# Altium project ELF 2 & ELF 2_Lite V1.3.PrjPcb (part 3 of 3)
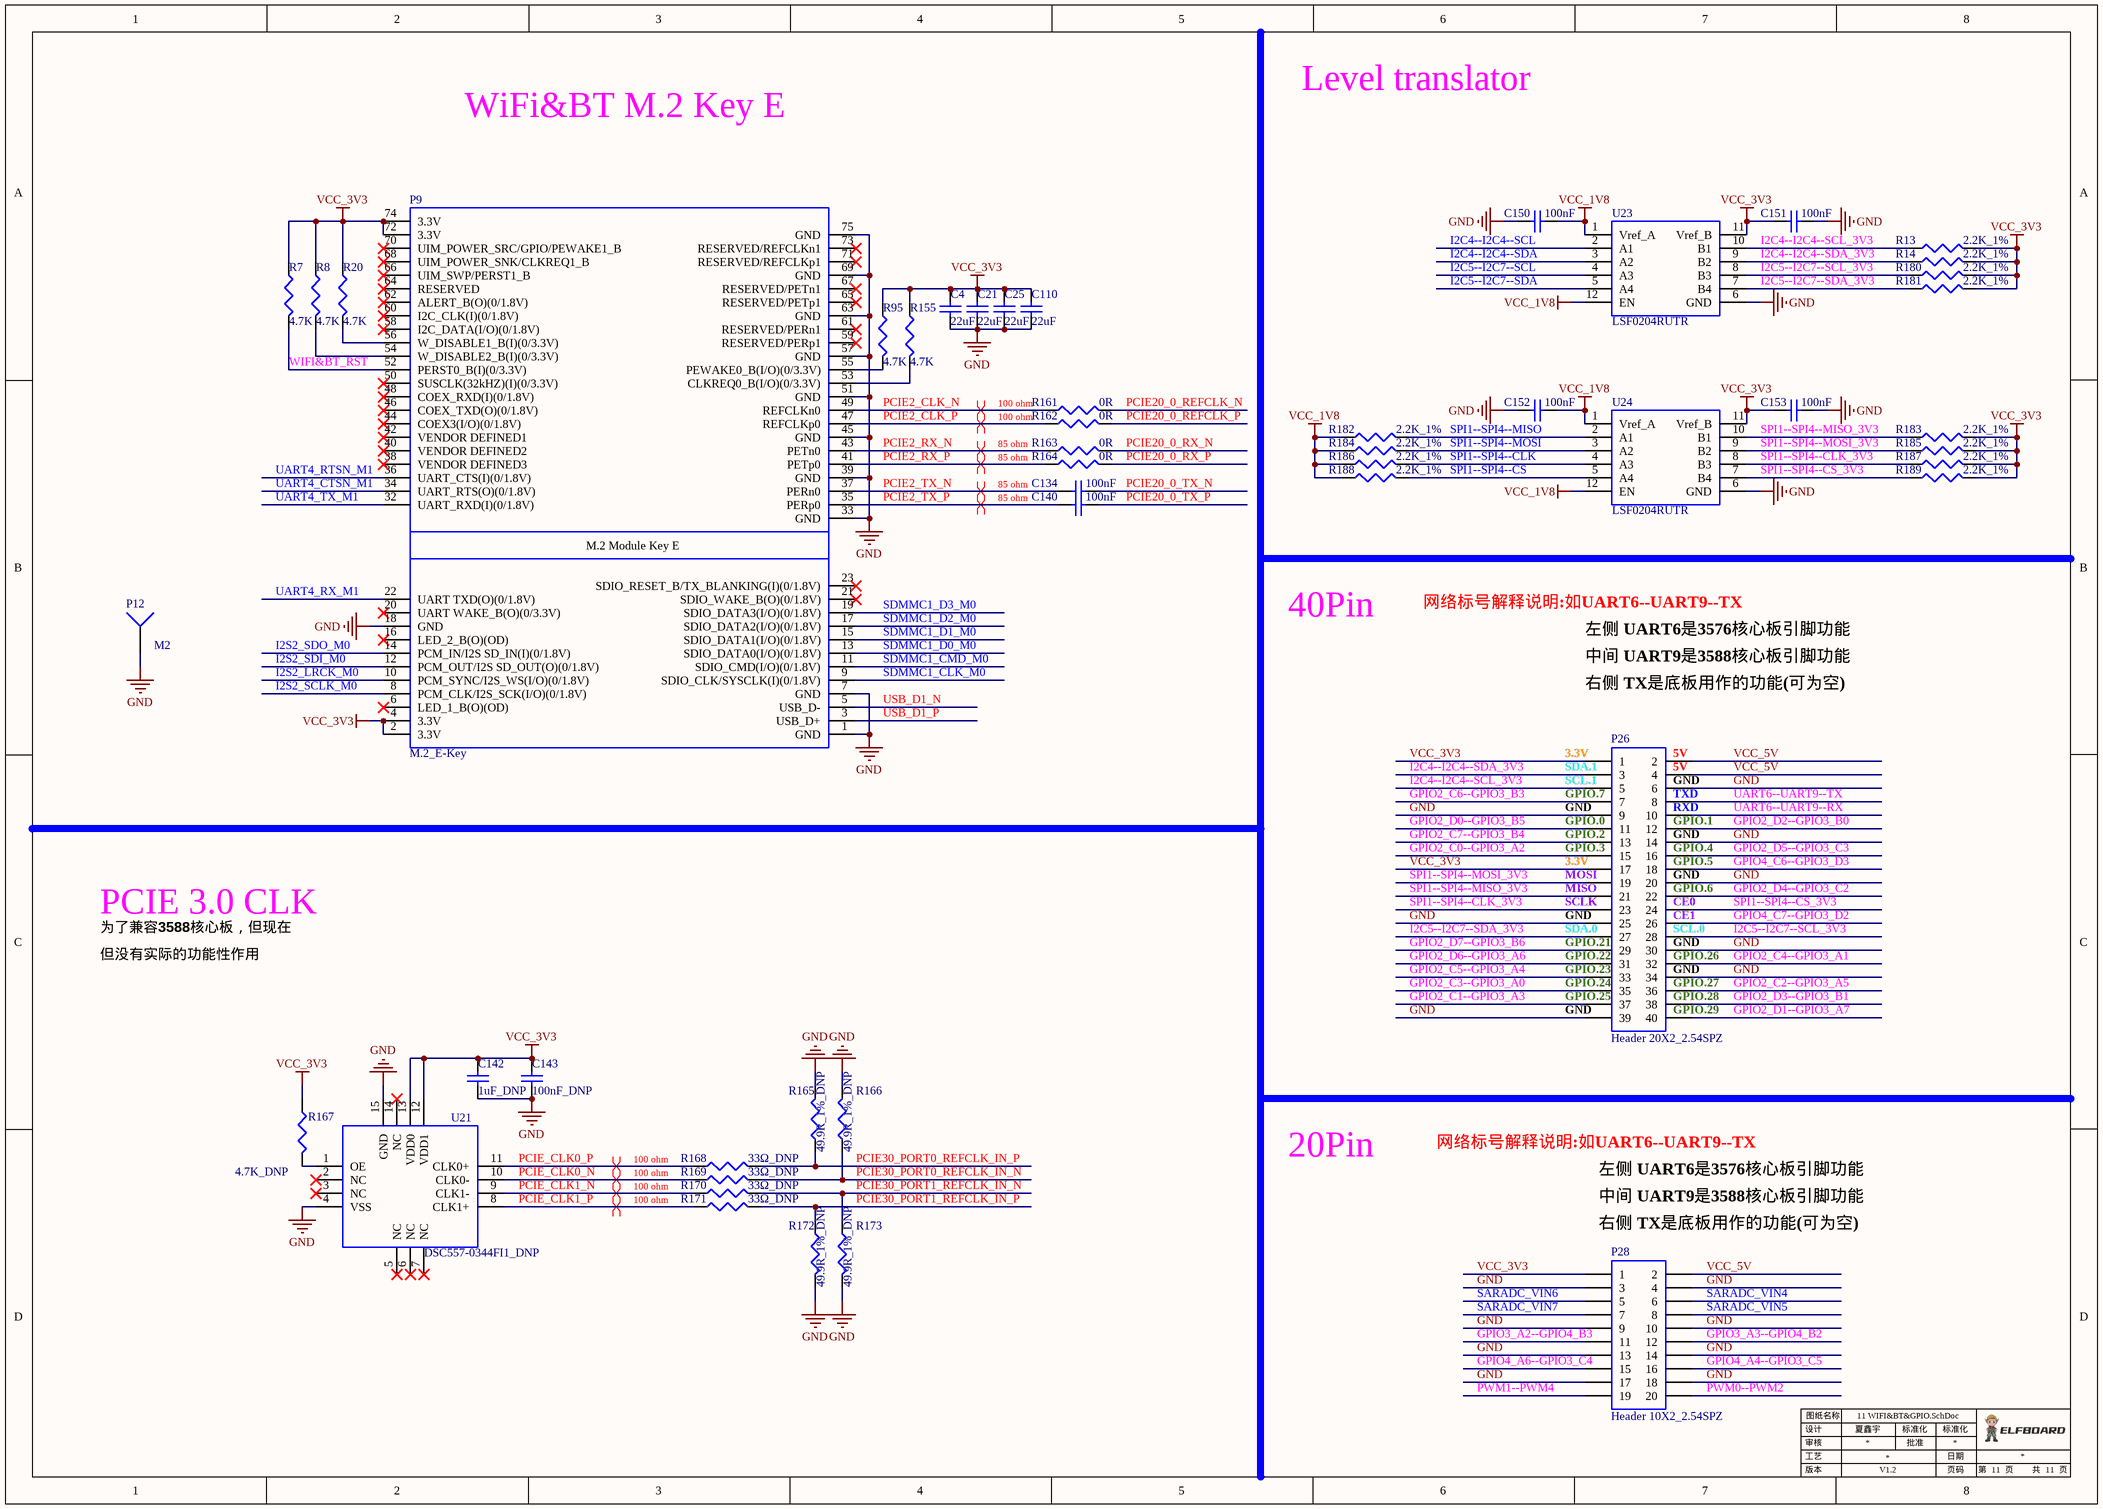
[diagram p14: 11 WIFI&BT&GPIO.SchDoc]

## Nets that join several sheets
GND: 02 Connector (103 pins), 03 PWR (54 pins), 04 Debug&TF card&RTC (29 pins), 05 Ethernet (30 pins), 06 MIPI (42 pins), 07 HDMI (26 pins), 08 TypeC USB DP (33 pins), 09 Audio (37 pins), 10 USB2.0 HUB&PCIe (52 pins), 11 WIFI&BT&GPIO (46 pins)
VCC12V_DCIN: 02 Connector (10 pins), 03 PWR (9 pins)
VCC_1V8: 02 Connector (6 pins), 03 PWR (C6.2 U1.5), 04 Debug&TF card&RTC (R45.1), 05 Ethernet (Q7.1 R70.1 R74.2 R75.1), 07 HDMI (R96.1 R97.1), 08 TypeC USB DP (R113.2), 11 WIFI&BT&GPIO (10 pins)
VCC_3V3: 02 Connector (R1.1 R2.1 R5.1 R6.1), 03 PWR (9 pins), 04 Debug&TF card&RTC (9 pins), 05 Ethernet (10 pins), 06 MIPI (10 pins), 07 HDMI (5 pins), 08 TypeC USB DP (8 pins), 09 Audio (C115.2 R125.1 U18.1), 10 USB2.0 HUB&PCIe (19 pins), 11 WIFI&BT&GPIO (33 pins)
VCC_5V: 03 PWR (13 pins), 06 MIPI (6 pins), 07 HDMI (5 pins), 08 TypeC USB DP (7 pins), 09 Audio (5 pins), 10 USB2.0 HUB&PCIe (7 pins), 11 WIFI&BT&GPIO (P26.2 P26.4 P28.2)
CARRIER_EN: 02 Connector (P3.87), 03 PWR (Q1.2)
DP_TX_AUX_N: 02 Connector (P3.24), 08 TypeC USB DP (C83.1)
DP_TX_AUX_P: 02 Connector (P3.22), 08 TypeC USB DP (C82.1)
GMAC0_INT: 02 Connector (P3.94), 05 Ethernet (D4.1 R74.1)
GMAC0_MDC_M0: 02 Connector (P4.49), 05 Ethernet (U7.14)
GMAC0_MDIO_M0: 02 Connector (P4.47), 05 Ethernet (R70.2 U7.15)
GMAC0_RESET: 02 Connector (P3.92), 05 Ethernet (Q7.2 R75.2)
GMAC0_RXCLK_M0: 02 Connector (P4.34), 05 Ethernet (R54.1 R64.1)
GMAC0_RXCTL_M0: 02 Connector (P4.32), 05 Ethernet (R56.1 R63.1)
GMAC0_RXD0_M0: 02 Connector (P4.30), 05 Ethernet (R61.1 R62.1)
GMAC0_RXD1_M0: 02 Connector (P4.28), 05 Ethernet (R60.1 R65.1)
GMAC0_RXD2_M0: 02 Connector (P4.26), 05 Ethernet (R59.1 R66.1)
GMAC0_RXD3_M0: 02 Connector (P4.24), 05 Ethernet (R58.1 R67.1)
GMAC0_TXCLK_M0: 02 Connector (P4.20), 05 Ethernet (R57.1)
GMAC0_TXCTL_M0: 02 Connector (P4.18), 05 Ethernet (R55.1)
GMAC0_TXD0_M0: 02 Connector (P4.16), 05 Ethernet (R53.1)
GMAC0_TXD1_M0: 02 Connector (P4.14), 05 Ethernet (R51.1)
GMAC0_TXD2_M0: 02 Connector (P4.12), 05 Ethernet (R50.1)
GMAC0_TXD3_M0: 02 Connector (P4.10), 05 Ethernet (R49.1)
GPIO0_A5--GPIO1_B0--TYPEC0_INT: 02 Connector (P2.75), 08 TypeC USB DP (D8.1 R113.1)
GPIO0_B6--GPIO3_C7--TF_PWR: 02 Connector (P4.33), 04 Debug&TF card&RTC (R37.1)
GPIO0_C5--GPIO3_C0--MIPI_DSI_INT: 02 Connector (P4.1), 06 MIPI (P15.30)
GPIO0_C6--GPIO3_B2--MIPI_DSI_EN: 02 Connector (P4.39), 06 MIPI (P15.9)
GPIO0_D0--GPIO3_B7--MIPI_DSI_RESET: 02 Connector (P4.9), 06 MIPI (P15.29)
GPIO0_D1--GPIO0_D0--PWREN: 02 Connector (P4.4), 08 TypeC USB DP (R103.1)
GPIO0_D3--GPIO1_B2--HP_DET_L: 02 Connector (P2.29), 09 Audio (R127.1 R130.1)
GPIO2_A6--GPIO4_A0--PUPDCTL1: 02 Connector (P1.82), 08 TypeC USB DP (R100.1)
GPIO2_A7--GPIO4_B0--PUPDCTL2: 02 Connector (P1.48), 08 TypeC USB DP (R106.1)
GPIO2_B0--GPIO4_B1--HDMI_ON: 02 Connector (P1.46), 07 HDMI (Q10.1 Q11.1 Q12.1 Q13.1)
GPIO2_B1--GPIO4_A1--USB_RST: 02 Connector (P1.80), 10 USB2.0 HUB&PCIe (R157.2)
GPIO2_B3--GPIO4_A2--EN: 02 Connector (P1.76), 06 MIPI (P16.5)
GPIO2_B5--GPIO4_B6--GPIO: 02 Connector (P1.50), 06 MIPI (P16.4)
GPIO2_C0--GPIO3_A2: 02 Connector (P4.54), 11 WIFI&BT&GPIO (P26.15)
GPIO2_C1--GPIO3_A3: 02 Connector (P4.52), 11 WIFI&BT&GPIO (P26.37)
GPIO2_C2--GPIO3_A5: 02 Connector (P4.62), 11 WIFI&BT&GPIO (P26.36)
GPIO2_C3--GPIO3_A0: 02 Connector (P4.40), 11 WIFI&BT&GPIO (P26.35)
GPIO2_C4--GPIO3_A1: 02 Connector (P4.38), 11 WIFI&BT&GPIO (P26.32)
GPIO2_C5--GPIO3_A4: 02 Connector (P4.48), 11 WIFI&BT&GPIO (P26.33)
GPIO2_C6--GPIO3_B3: 02 Connector (P4.44), 11 WIFI&BT&GPIO (P26.7)
GPIO2_C7--GPIO3_B4: 02 Connector (P4.42), 11 WIFI&BT&GPIO (P26.13)
GPIO2_D0--GPIO3_B5: 02 Connector (P4.46), 11 WIFI&BT&GPIO (P26.11)
GPIO2_D1--GPIO3_A7: 02 Connector (P4.58), 11 WIFI&BT&GPIO (P26.40)
GPIO2_D2--GPIO3_B0: 02 Connector (P4.56), 11 WIFI&BT&GPIO (P26.12)
GPIO2_D3--GPIO3_B1: 02 Connector (P4.60), 11 WIFI&BT&GPIO (P26.38)
GPIO2_D4--GPIO3_C2: 02 Connector (P4.7), 11 WIFI&BT&GPIO (P26.22)
GPIO2_D5--GPIO3_C3: 02 Connector (P4.5), 11 WIFI&BT&GPIO (P26.16)
GPIO2_D6--GPIO3_A6: 02 Connector (P4.35), 11 WIFI&BT&GPIO (P26.31)
GPIO2_D7--GPIO3_B6: 02 Connector (P4.37), 11 WIFI&BT&GPIO (P26.29)
GPIO3_A2--GPIO4_B3: 02 Connector (P1.66), 11 WIFI&BT&GPIO (P28.11)
GPIO3_A3--GPIO4_B2: 02 Connector (P1.54), 11 WIFI&BT&GPIO (P28.12)
GPIO3_D6--GPIO1_C6--CAM1_nRST: 02 Connector (P2.51), 06 MIPI (P14.19)
GPIO4_A4--GPIO3_C5: 02 Connector (P4.29), 11 WIFI&BT&GPIO (P28.16)
GPIO4_A6--GPIO3_C4: 02 Connector (P4.31), 11 WIFI&BT&GPIO (P28.15)
GPIO4_B1--GPIO1_D3--CAM1_PWRDN: 02 Connector (P2.61), 06 MIPI (P14.20)
GPIO4_C0--GPIO4_C1--HDMI_CEC: 02 Connector (P1.52), 07 HDMI (Q14.2 R94.2)
GPIO4_C1--GPIO1_A5--HPDIN: 02 Connector (P2.71), 07 HDMI (Q15.3 R96.2)
GPIO4_C2--GPIO4_B7--HDMI_SCL: 02 Connector (P1.68), 07 HDMI (Q8.2 R81.2)
GPIO4_C3--GPIO4_C0--HDMI_SDA: 02 Connector (P1.58), 07 HDMI (C71.1 Q9.2 R83.2)
GPIO4_C6--GPIO3_D3: 02 Connector (P4.17), 11 WIFI&BT&GPIO (P26.18)
GPIO4_C7--GPIO3_D2: 02 Connector (P4.19), 11 WIFI&BT&GPIO (P26.26)
HDMI_TX_D0_N: 02 Connector (P1.29), 07 HDMI (C65.1)
HDMI_TX_D0_P: 02 Connector (P1.31), 07 HDMI (C66.1)
HDMI_TX_D1_N: 02 Connector (P1.35), 07 HDMI (C67.1)
HDMI_TX_D1_P: 02 Connector (P1.37), 07 HDMI (C68.1)
HDMI_TX_D2_N: 02 Connector (P1.41), 07 HDMI (C69.1)
HDMI_TX_D2_P: 02 Connector (P1.43), 07 HDMI (C70.1)
HDMI_TX_D3_N: 02 Connector (P1.23), 07 HDMI (C63.1)
HDMI_TX_D3_P: 02 Connector (P1.25), 07 HDMI (C64.1)
HDMI_TX_SBD_N: 02 Connector (P1.17), 07 HDMI (C73.1)
HDMI_TX_SBD_P: 02 Connector (P1.19), 07 HDMI (C72.1)
I2C2--I2C2--SCL: 02 Connector (P2.11 R1.2), 06 MIPI (P15.26), 08 TypeC USB DP (U16.6)
I2C2--I2C2--SDA: 02 Connector (P2.1 R2.2), 06 MIPI (P15.27), 08 TypeC USB DP (U16.7)
I2C3--I2C3--SCL: 02 Connector (P2.35 R3.2), 06 MIPI (P14.18), 09 Audio (C103.2 U17.16)
I2C3--I2C3--SDA: 02 Connector (P2.43 R4.2), 06 MIPI (P14.17), 09 Audio (C102.2 U17.17)
I2C4--I2C4--SCL: 02 Connector (P4.45 R10.2), 11 WIFI&BT&GPIO (U23.2)
I2C4--I2C4--SDA: 02 Connector (P4.43 R9.2), 11 WIFI&BT&GPIO (U23.3)
I2C5--I2C7--SCL: 02 Connector (P2.31 R11.2), 11 WIFI&BT&GPIO (U23.4)
I2C5--I2C7--SDA: 02 Connector (P2.33 R12.2), 11 WIFI&BT&GPIO (U23.5)
I2C7--I2C5--SCL: 02 Connector (P1.70 R5.2), 04 Debug&TF card&RTC (U6.6), 06 MIPI (P16.3)
I2C7--I2C5--SDA: 02 Connector (P1.72 R6.2), 04 Debug&TF card&RTC (U6.5), 06 MIPI (P16.2)
I2S1--I2S0--LRCK: 02 Connector (P2.53), 09 Audio (R118.1)
I2S1--I2S0--MCLK: 02 Connector (P2.65), 09 Audio (R116.1)
I2S1--I2S0--SCLK: 02 Connector (P2.55), 09 Audio (R117.1)
I2S1--I2S0--SDI0: 02 Connector (P2.59), 09 Audio (R120.1)
I2S1--I2S0--SDO0: 02 Connector (P2.49), 09 Audio (R119.1)
I2S2_LRCK_M0: 02 Connector (P3.51), 11 WIFI&BT&GPIO (P9.10)
I2S2_SCLK_M0: 02 Connector (P3.47), 11 WIFI&BT&GPIO (P9.8)
I2S2_SDI_M0: 02 Connector (P3.53), 11 WIFI&BT&GPIO (P9.12)
I2S2_SDO_M0: 02 Connector (P3.45), 11 WIFI&BT&GPIO (P9.14)
MIPI_DPHY_CSI0_RX_CLK_N: 02 Connector (P3.72), 06 MIPI (P14.3)
MIPI_DPHY_CSI0_RX_CLK_P: 02 Connector (P3.70), 06 MIPI (P14.2)
MIPI_DPHY_CSI0_RX_D0_N: 02 Connector (P3.60), 06 MIPI (P14.6)
MIPI_DPHY_CSI0_RX_D0_P: 02 Connector (P3.58), 06 MIPI (P14.5)
MIPI_DPHY_CSI0_RX_D1_N: 02 Connector (P3.66), 06 MIPI (P14.9)
MIPI_DPHY_CSI0_RX_D1_P: 02 Connector (P3.64), 06 MIPI (P14.8)
MIPI_DPHY_CSI0_RX_D2_N: 02 Connector (P3.78), 06 MIPI (P14.12)
MIPI_DPHY_CSI0_RX_D2_P: 02 Connector (P3.76), 06 MIPI (P14.11)
MIPI_DPHY_CSI0_RX_D3_N: 02 Connector (P3.84), 06 MIPI (P14.15)
MIPI_DPHY_CSI0_RX_D3_P: 02 Connector (P3.82), 06 MIPI (P14.14)
MIPI_DPHY_CSI2_RX_CLK_N: 02 Connector (P4.95), 06 MIPI (P16.8)
MIPI_DPHY_CSI2_RX_CLK_P: 02 Connector (P4.97), 06 MIPI (P16.7)
MIPI_DPHY_CSI2_RX_D0_N: 02 Connector (P4.83), 06 MIPI (P16.14)
MIPI_DPHY_CSI2_RX_D0_P: 02 Connector (P4.85), 06 MIPI (P16.13)
MIPI_DPHY_CSI2_RX_D1_N: 02 Connector (P4.89), 06 MIPI (P16.11)
MIPI_DPHY_CSI2_RX_D1_P: 02 Connector (P4.91), 06 MIPI (P16.10)
MIPI_DPHY_DSI_TX_CLK_N: 02 Connector (P3.69), 06 MIPI (P15.18)
MIPI_DPHY_DSI_TX_CLK_P: 02 Connector (P3.71), 06 MIPI (P15.17)
MIPI_DPHY_DSI_TX_D0_N: 02 Connector (P3.57), 06 MIPI (P15.24)
MIPI_DPHY_DSI_TX_D0_P: 02 Connector (P3.59), 06 MIPI (P15.23)
MIPI_DPHY_DSI_TX_D1_N: 02 Connector (P3.63), 06 MIPI (P15.21)
MIPI_DPHY_DSI_TX_D1_P: 02 Connector (P3.65), 06 MIPI (P15.20)
MIPI_DPHY_DSI_TX_D2_N: 02 Connector (P3.75), 06 MIPI (P15.15)
MIPI_DPHY_DSI_TX_D2_P: 02 Connector (P3.77), 06 MIPI (P15.14)
MIPI_DPHY_DSI_TX_D3_N: 02 Connector (P3.81), 06 MIPI (P15.12)
MIPI_DPHY_DSI_TX_D3_P: 02 Connector (P3.83), 06 MIPI (P15.11)
PCIE0_REFCLK_N: 02 Connector (P2.64), 10 USB2.0 HUB&PCIe (R154.2)
PCIE0_REFCLK_P: 02 Connector (P2.66), 10 USB2.0 HUB&PCIe (R153.2)
PCIE0_RX_N: 02 Connector (P2.70), 10 USB2.0 HUB&PCIe (R160.2)
PCIE0_RX_P: 02 Connector (P2.72), 10 USB2.0 HUB&PCIe (R159.2)
PCIE0_TX_N: 02 Connector (P2.76), 10 USB2.0 HUB&PCIe (R158.2)
PCIE0_TX_P: 02 Connector (P2.78), 10 USB2.0 HUB&PCIe (R156.2)
PCIE20_0_REFCLK_N: 02 Connector (P2.82), 11 WIFI&BT&GPIO (R161.2)
PCIE20_0_REFCLK_P: 02 Connector (P2.84), 11 WIFI&BT&GPIO (R162.2)
PCIE20_0_RX_N: 02 Connector (P2.94), 11 WIFI&BT&GPIO (R163.2)
PCIE20_0_RX_P: 02 Connector (P2.96), 11 WIFI&BT&GPIO (R164.2)
PCIE20_0_TX_N: 02 Connector (P2.88), 11 WIFI&BT&GPIO (C134.2)
PCIE20_0_TX_P: 02 Connector (P2.90), 11 WIFI&BT&GPIO (C140.2)
PCIE30_PORT0_REFCLK_IN_N: 02 Connector (P2.46), 11 WIFI&BT&GPIO (R166.1 R169.2)
PCIE30_PORT0_REFCLK_IN_P: 02 Connector (P2.48), 11 WIFI&BT&GPIO (R165.1 R168.2)
PCIE30_PORT1_REFCLK_IN_N: 02 Connector (P2.6), 11 WIFI&BT&GPIO (R170.2 R173.1)
PCIE30_PORT1_REFCLK_IN_P: 02 Connector (P2.4), 11 WIFI&BT&GPIO (R171.2 R172.1)
PWM0--PWM2: 02 Connector (P2.3), 11 WIFI&BT&GPIO (P28.20)
PWM0--PWM5: 02 Connector (P2.13), 06 MIPI (P15.8)
PWM1--PWM4: 02 Connector (P2.5), 11 WIFI&BT&GPIO (P28.19)
RESET_L: 02 Connector (P2.100), 03 PWR (5 pins)
SARADC_VIN0_BOOT: 02 Connector (P1.28), 03 PWR (C12.2 DT4.1 K1.1 K1.2)
SARADC_VIN1_RECOVERY: 02 Connector (P1.30), 03 PWR (C20.2 DT6.1 K3.1 K3.2)
SARADC_VIN3_HP_HOOK: 02 Connector (P1.34), 09 Audio (R124.1 R126.2)
SARADC_VIN4: 02 Connector (P1.36), 11 WIFI&BT&GPIO (P28.6)
SARADC_VIN5: 02 Connector (P1.38), 11 WIFI&BT&GPIO (P28.8)
SARADC_VIN6: 02 Connector (P1.40), 11 WIFI&BT&GPIO (P28.5)
SARADC_VIN7: 02 Connector (P1.42), 11 WIFI&BT&GPIO (P28.7)
SDMMC0_CLK: 02 Connector (P1.7), 04 Debug&TF card&RTC (R42.1)
SDMMC0_CMD: 02 Connector (P1.9), 04 Debug&TF card&RTC (R41.1)
SDMMC0_D0: 02 Connector (P1.5), 04 Debug&TF card&RTC (R43.1)
SDMMC0_D1: 02 Connector (P1.3), 04 Debug&TF card&RTC (R44.1)
SDMMC0_D2: 02 Connector (P1.13), 04 Debug&TF card&RTC (R39.1)
SDMMC0_D3: 02 Connector (P1.11), 04 Debug&TF card&RTC (R40.1)
SDMMC0_DET_L: 02 Connector (P3.90), 04 Debug&TF card&RTC (R45.2 R46.1)
SDMMC1_CLK_M0: 02 Connector (P3.33), 11 WIFI&BT&GPIO (P9.9)
SDMMC1_CMD_M0: 02 Connector (P3.35), 11 WIFI&BT&GPIO (P9.11)
SDMMC1_D0_M0: 02 Connector (P3.29), 11 WIFI&BT&GPIO (P9.13)
SDMMC1_D1_M0: 02 Connector (P3.27), 11 WIFI&BT&GPIO (P9.15)
SDMMC1_D2_M0: 02 Connector (P3.41), 11 WIFI&BT&GPIO (P9.17)
SDMMC1_D3_M0: 02 Connector (P3.39), 11 WIFI&BT&GPIO (P9.19)
SPI1--SPI4--CLK: 02 Connector (P2.77), 11 WIFI&BT&GPIO (R186.2 U24.4)
SPI1--SPI4--CS: 02 Connector (P2.79), 11 WIFI&BT&GPIO (R188.2 U24.5)
SPI1--SPI4--MISO: 02 Connector (P2.69), 11 WIFI&BT&GPIO (R182.2 U24.2)
SPI1--SPI4--MOSI: 02 Connector (P2.73), 11 WIFI&BT&GPIO (R184.2 U24.3)
UART0--UART2--RX_DEBUG: 02 Connector (P2.9), 04 Debug&TF card&RTC (Q5.2 R47.2)
UART0--UART2--TX_DEBUG: 02 Connector (P2.7), 04 Debug&TF card&RTC (Q6.2 R48.2)
UART4_CTSN_M1: 02 Connector (P3.36), 11 WIFI&BT&GPIO (P9.34)
UART4_RTSN_M1: 02 Connector (P3.34), 11 WIFI&BT&GPIO (P9.36)
UART4_RX_M1: 02 Connector (P3.30), 11 WIFI&BT&GPIO (P9.22)
UART4_TX_M1: 02 Connector (P3.28), 11 WIFI&BT&GPIO (P9.32)
UART6--UART9--RX: 02 Connector (P4.23), 11 WIFI&BT&GPIO (P26.10)
UART6--UART9--TX: 02 Connector (P4.21), 11 WIFI&BT&GPIO (P26.8)
USB2_HOST1_D_N: 02 Connector (P1.94), 10 USB2.0 HUB&PCIe (U20.14)
USB2_HOST1_D_P: 02 Connector (P1.92), 10 USB2.0 HUB&PCIe (U20.15)
USB2_OTG0_D_N: 02 Connector (P3.18), 08 TypeC USB DP (R107.1)
USB2_OTG0_D_P: 02 Connector (P3.20), 08 TypeC USB DP (R108.1)
USB2_OTG0_VBUSDET: 02 Connector (P3.16), 08 TypeC USB DP (R115.1)
USB2_OTG1_VBUSDET: 02 Connector (P1.100), 10 USB2.0 HUB&PCIe (R135.1 R136.2)
USB3_HOST1_SSRX_N: 02 Connector (P2.97), 10 USB2.0 HUB&PCIe (R148.1)
USB3_HOST1_SSRX_P: 02 Connector (P2.95), 10 USB2.0 HUB&PCIe (R152.1)
USB3_HOST1_SSTX_N: 02 Connector (P2.91), 10 USB2.0 HUB&PCIe (C132.1)
USB3_HOST1_SSTX_P: 02 Connector (P2.89), 10 USB2.0 HUB&PCIe (C133.1)
USB3_OTG0_SSRX1_N: 02 Connector (P3.3), 08 TypeC USB DP (R109.1)
USB3_OTG0_SSRX1_P: 02 Connector (P3.5), 08 TypeC USB DP (R110.1)
USB3_OTG0_SSRX2_N: 02 Connector (P3.15), 08 TypeC USB DP (R111.1)
USB3_OTG0_SSRX2_P: 02 Connector (P3.17), 08 TypeC USB DP (R112.1)
USB3_OTG0_SSTX1_N: 02 Connector (P3.11), 08 TypeC USB DP (C86.1)
USB3_OTG0_SSTX1_P: 02 Connector (P3.9), 08 TypeC USB DP (C87.1)
USB3_OTG0_SSTX2_N: 02 Connector (P3.23), 08 TypeC USB DP (C88.1)
USB3_OTG0_SSTX2_P: 02 Connector (P3.21), 08 TypeC USB DP (C89.1)
USB_D1_N: 10 USB2.0 HUB&PCIe (U20.11), 11 WIFI&BT&GPIO (P9.5)
USB_D1_P: 10 USB2.0 HUB&PCIe (U20.12), 11 WIFI&BT&GPIO (P9.3)